# Altium schematic sheet Top-Sheet.SchDoc
size A4; SheetNumber: 1; SheetTotal: 8
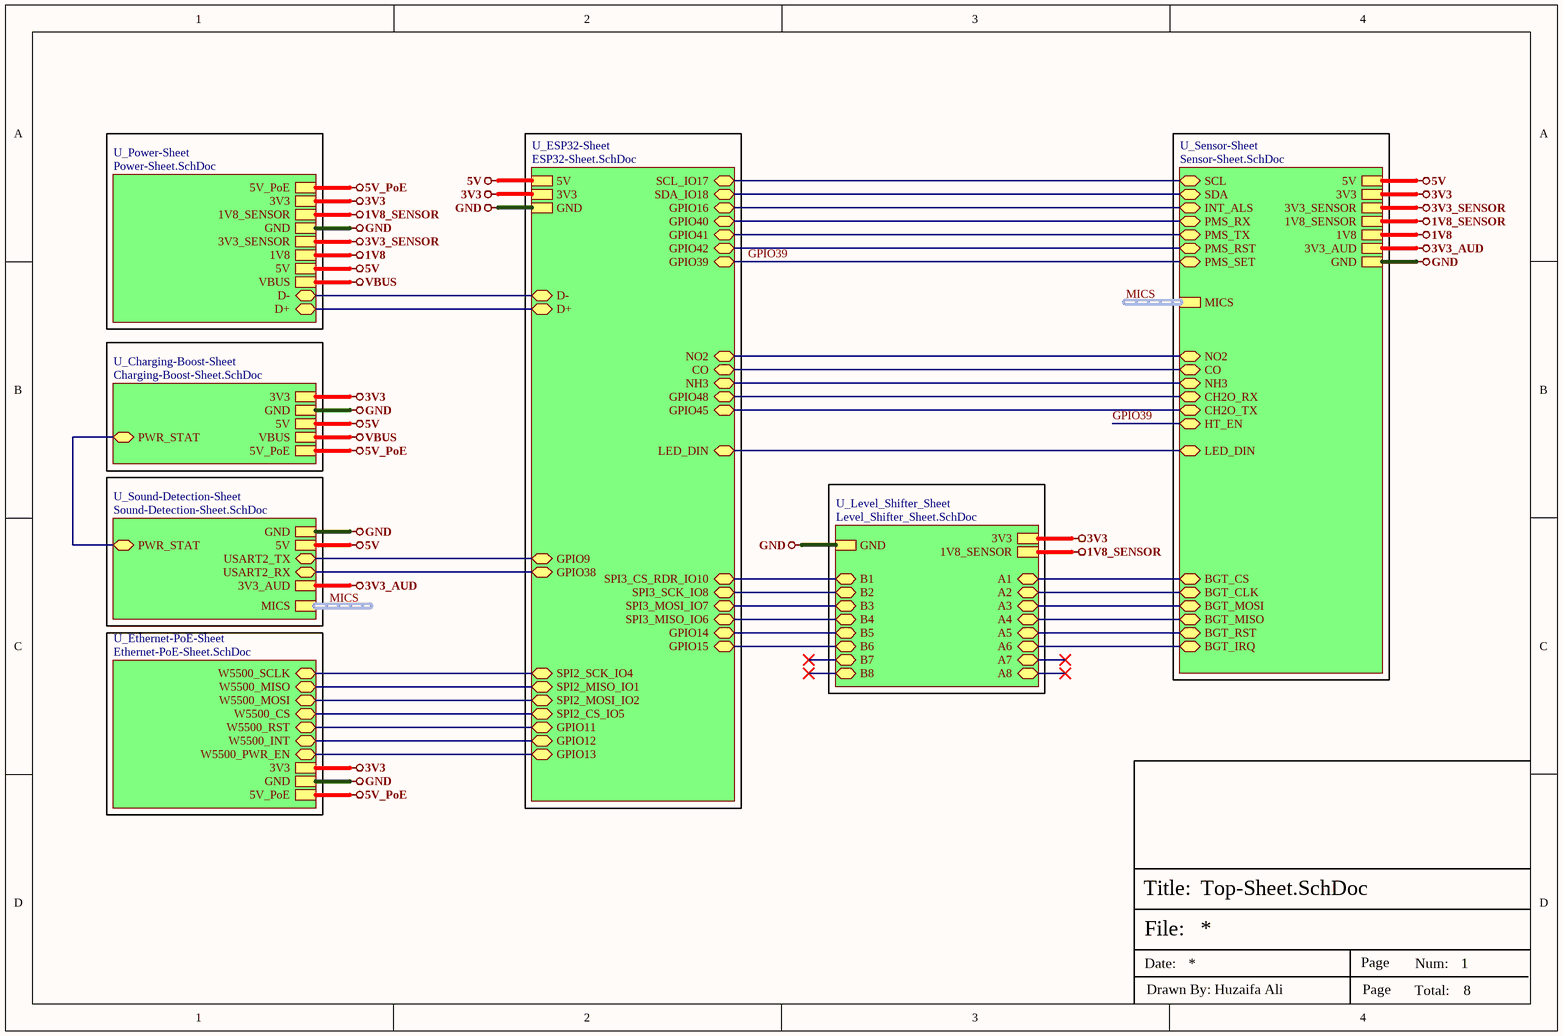
[diagram p0: Top-Sheet.SchDoc]

## Sub-sheets
U_Charging-Boost-Sheet = Charging-Boost-Sheet.SchDoc: 3V3, GND, 5V, VBUS, 5V_PoE, PWR_STAT (bidir)
U_ESP32-Sheet = ESP32-Sheet.SchDoc: SDA_IO18 (bidir), SCL_IO17 (bidir), D- (bidir), D+ (bidir), NO2 (bidir), CO (bidir), NH3 (bidir), GPIO39 (bidir), GPIO40 (bidir), GPIO41 (bidir), GPIO42 (bidir), GPIO14 (bidir), GPIO15 (bidir), GPIO16 (bidir), SPI3_MISO_IO6 (bidir), SPI3_MOSI_IO7 (bidir), SPI3_SCK_IO8 (bidir), SPI3_CS_RDR_IO10 (bidir), GPIO11 (bidir), GPIO12 (bidir), GPIO13 (bidir), SPI2_CS_IO5 (bidir), SPI2_SCK_IO4 (bidir), 3V3, GND, 5V, GPIO9 (bidir), SPI2_MISO_IO1 (bidir), SPI2_MOSI_IO2 (bidir), GPIO38 (bidir), GPIO45 (bidir), GPIO48 (bidir), LED_DIN (bidir)
U_Ethernet-PoE-Sheet = Ethernet-PoE-Sheet.SchDoc: W5500_SCLK (bidir), W5500_MISO (bidir), W5500_MOSI (bidir), W5500_RST (bidir), W5500_INT (bidir), W5500_CS (bidir), W5500_PWR_EN (bidir), 3V3, GND, 5V_PoE
U_Level_Shifter_Sheet = Level_Shifter_Sheet.SchDoc: 3V3, 1V8_SENSOR, GND, A1 (bidir), A2 (bidir), A3 (bidir), A4 (bidir), A5 (bidir), A6 (bidir), A7 (bidir), A8 (bidir), B1 (bidir), B2 (bidir), B3 (bidir), B4 (bidir), B5 (bidir), B6 (bidir), B7 (bidir), B8 (bidir)
U_Power-Sheet = Power-Sheet.SchDoc: 3V3, 1V8_SENSOR, GND, 3V3_SENSOR, 1V8, 5V, VBUS, D- (bidir), D+ (bidir), 5V_PoE
U_Sensor-Sheet = Sensor-Sheet.SchDoc: SDA (bidir), SCL (bidir), BGT_CS (bidir), BGT_CLK (bidir), BGT_MOSI (bidir), BGT_RST (bidir), BGT_IRQ (bidir), BGT_MISO (bidir), PMS_SET (bidir), PMS_RX (bidir), PMS_TX (bidir), PMS_RST (bidir), INT_ALS (bidir), NO2 (bidir), CO (bidir), NH3 (bidir), CH2O_RX (bidir), CH2O_TX (bidir), 3V3, 1V8_SENSOR, GND, 3V3_SENSOR, 1V8, 5V, HT_EN (bidir), MICS (harness MICS), 3V3_AUD, LED_DIN (bidir)
U_Sound-Detection-Sheet = Sound-Detection-Sheet.SchDoc: GND, 5V, USART2_TX (bidir), USART2_RX (bidir), PWR_STAT (bidir), 3V3_AUD, MICS (harness MICS)

## Nets
1V8: sheet U_Power-Sheet/1V8, sheet U_Sensor-Sheet/1V8
1V8_SENSOR: sheet U_Power-Sheet/1V8_SENSOR, sheet U_Sensor-Sheet/1V8_SENSOR, sheet U_Level_Shifter_Sheet/1V8_SENSOR
3V3: sheet U_Power-Sheet/3V3, sheet U_Charging-Boost-Sheet/3V3, sheet U_Sensor-Sheet/3V3, sheet U_Level_Shifter_Sheet/3V3, sheet U_ESP32-Sheet/3V3, sheet U_Ethernet-PoE-Sheet/3V3
3V3_AUD: sheet U_Sensor-Sheet/3V3_AUD, sheet U_Sound-Detection-Sheet/3V3_AUD
3V3_SENSOR: sheet U_Power-Sheet/3V3_SENSOR, sheet U_Sensor-Sheet/3V3_SENSOR
5V: sheet U_Power-Sheet/5V, sheet U_Charging-Boost-Sheet/5V, sheet U_Sensor-Sheet/5V, sheet U_ESP32-Sheet/5V, sheet U_Sound-Detection-Sheet/5V
5V_PoE: sheet U_Power-Sheet/5V_PoE, sheet U_Charging-Boost-Sheet/5V_PoE, sheet U_Ethernet-PoE-Sheet/5V_PoE
GND: sheet U_Power-Sheet/GND, sheet U_Charging-Boost-Sheet/GND, sheet U_Sensor-Sheet/GND, sheet U_Level_Shifter_Sheet/GND, sheet U_ESP32-Sheet/GND, sheet U_Ethernet-PoE-Sheet/GND, sheet U_Sound-Detection-Sheet/GND
VBUS: sheet U_Power-Sheet/VBUS, sheet U_Charging-Boost-Sheet/VBUS
GPIO39: sheet U_Sensor-Sheet/PMS_SET, sheet U_Sensor-Sheet/HT_EN, sheet U_ESP32-Sheet/GPIO39
(unnamed): sheet U_Power-Sheet/D-, sheet U_ESP32-Sheet/D-
(unnamed): sheet U_Power-Sheet/D+, sheet U_ESP32-Sheet/D+
(unnamed): sheet U_Charging-Boost-Sheet/PWR_STAT, sheet U_Sound-Detection-Sheet/PWR_STAT
(unnamed): sheet U_Sensor-Sheet/SDA, sheet U_ESP32-Sheet/SDA_IO18
(unnamed): sheet U_Sensor-Sheet/SCL, sheet U_ESP32-Sheet/SCL_IO17
(unnamed): sheet U_Sensor-Sheet/BGT_CS, sheet U_Level_Shifter_Sheet/A1
(unnamed): sheet U_Sensor-Sheet/BGT_CLK, sheet U_Level_Shifter_Sheet/A2
(unnamed): sheet U_Sensor-Sheet/BGT_MOSI, sheet U_Level_Shifter_Sheet/A3
(unnamed): sheet U_Sensor-Sheet/BGT_RST, sheet U_Level_Shifter_Sheet/A5
(unnamed): sheet U_Sensor-Sheet/BGT_IRQ, sheet U_Level_Shifter_Sheet/A6
(unnamed): sheet U_Sensor-Sheet/BGT_MISO, sheet U_Level_Shifter_Sheet/A4
(unnamed): sheet U_Sensor-Sheet/PMS_RX, sheet U_ESP32-Sheet/GPIO40
(unnamed): sheet U_Sensor-Sheet/PMS_TX, sheet U_ESP32-Sheet/GPIO41
(unnamed): sheet U_Sensor-Sheet/PMS_RST, sheet U_ESP32-Sheet/GPIO42
(unnamed): sheet U_Sensor-Sheet/INT_ALS, sheet U_ESP32-Sheet/GPIO16
(unnamed): sheet U_Sensor-Sheet/NO2, sheet U_ESP32-Sheet/NO2
(unnamed): sheet U_Sensor-Sheet/CO, sheet U_ESP32-Sheet/CO
(unnamed): sheet U_Sensor-Sheet/NH3, sheet U_ESP32-Sheet/NH3
(unnamed): sheet U_Sensor-Sheet/CH2O_RX, sheet U_ESP32-Sheet/GPIO48
(unnamed): sheet U_Sensor-Sheet/CH2O_TX, sheet U_ESP32-Sheet/GPIO45
(unnamed): sheet U_Sensor-Sheet/LED_DIN, sheet U_ESP32-Sheet/LED_DIN
(unnamed): sheet U_Level_Shifter_Sheet/B1, sheet U_ESP32-Sheet/SPI3_CS_RDR_IO10
(unnamed): sheet U_Level_Shifter_Sheet/B2, sheet U_ESP32-Sheet/SPI3_SCK_IO8
(unnamed): sheet U_Level_Shifter_Sheet/B3, sheet U_ESP32-Sheet/SPI3_MOSI_IO7
(unnamed): sheet U_Level_Shifter_Sheet/B4, sheet U_ESP32-Sheet/SPI3_MISO_IO6
(unnamed): sheet U_Level_Shifter_Sheet/B5, sheet U_ESP32-Sheet/GPIO14
(unnamed): sheet U_Level_Shifter_Sheet/B6, sheet U_ESP32-Sheet/GPIO15
(unnamed): sheet U_ESP32-Sheet/GPIO11, sheet U_Ethernet-PoE-Sheet/W5500_RST
(unnamed): sheet U_ESP32-Sheet/GPIO12, sheet U_Ethernet-PoE-Sheet/W5500_INT
(unnamed): sheet U_ESP32-Sheet/GPIO13, sheet U_Ethernet-PoE-Sheet/W5500_PWR_EN
(unnamed): sheet U_ESP32-Sheet/SPI2_CS_IO5, sheet U_Ethernet-PoE-Sheet/W5500_CS
(unnamed): sheet U_ESP32-Sheet/SPI2_SCK_IO4, sheet U_Ethernet-PoE-Sheet/W5500_SCLK
(unnamed): sheet U_ESP32-Sheet/GPIO9, sheet U_Sound-Detection-Sheet/USART2_TX
(unnamed): sheet U_ESP32-Sheet/SPI2_MISO_IO1, sheet U_Ethernet-PoE-Sheet/W5500_MISO
(unnamed): sheet U_ESP32-Sheet/SPI2_MOSI_IO2, sheet U_Ethernet-PoE-Sheet/W5500_MOSI
(unnamed): sheet U_ESP32-Sheet/GPIO38, sheet U_Sound-Detection-Sheet/USART2_RX

## Buses and harness runs
harness MICS = sheet U_Sensor-Sheet/MICS
harness MICS = sheet U_Sound-Detection-Sheet/MICS

## Notes on the sheet
- File:
- Title:
- Date:
- Page
- Num:
- Total:
- Drawn By: Huzaifa Ali